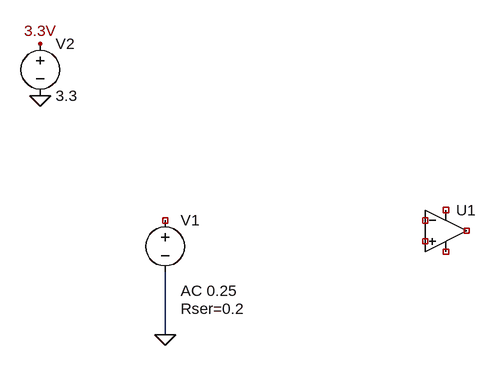
[diagram p0: schematic Draft5.asc]
Draft5.asc, the LTspice schematic file:
Version 4
SHEET 1 880 680
WIRE 32 304 32 208
FLAG 32 304 0
FLAG -160 -64 0
FLAG -160 -144 3.3V
SYMBOL voltage 32 112 R0
WINDOW 3 24 96 Invisible 2
WINDOW 123 24 124 Left 2
WINDOW 39 24 152 Left 2
SYMATTR InstName V1
SYMATTR Value 0.25
SYMATTR Value2 AC 0.25
SYMATTR SpiceLine Rser=0.2
SYMBOL OpAmps\\UniversalOpAmp2 464 144 R0
SYMATTR InstName U1
SYMBOL voltage -160 -160 R0
WINDOW 123 0 0 Left 0
WINDOW 39 0 0 Left 0
SYMATTR InstName V2
SYMATTR Value 3.3

The netlist it stands for:
* Draft5.asc
V1 NC_01 0 0.25 AC 0.25 Rser=0.2
XU1 NC_02 NC_03 NC_04 NC_05 NC_06 level2 Avol=1Meg GBW=10Meg Slew=10Meg Ilimit=25m Rail=0 Vos=0 En=0 Enk=0 In=0 Ink=0 Rin=500Meg  ; pins In+ In- V+ V- OUT
V2 3.3V 0 3.3
.lib UniversalOpAmp2.lib
.backanno
.end